# Altium schematic sheet Connector_Section.SchDoc
size A; DocumentNumber: 8; SheetNumber: 8; SheetTotal: 8
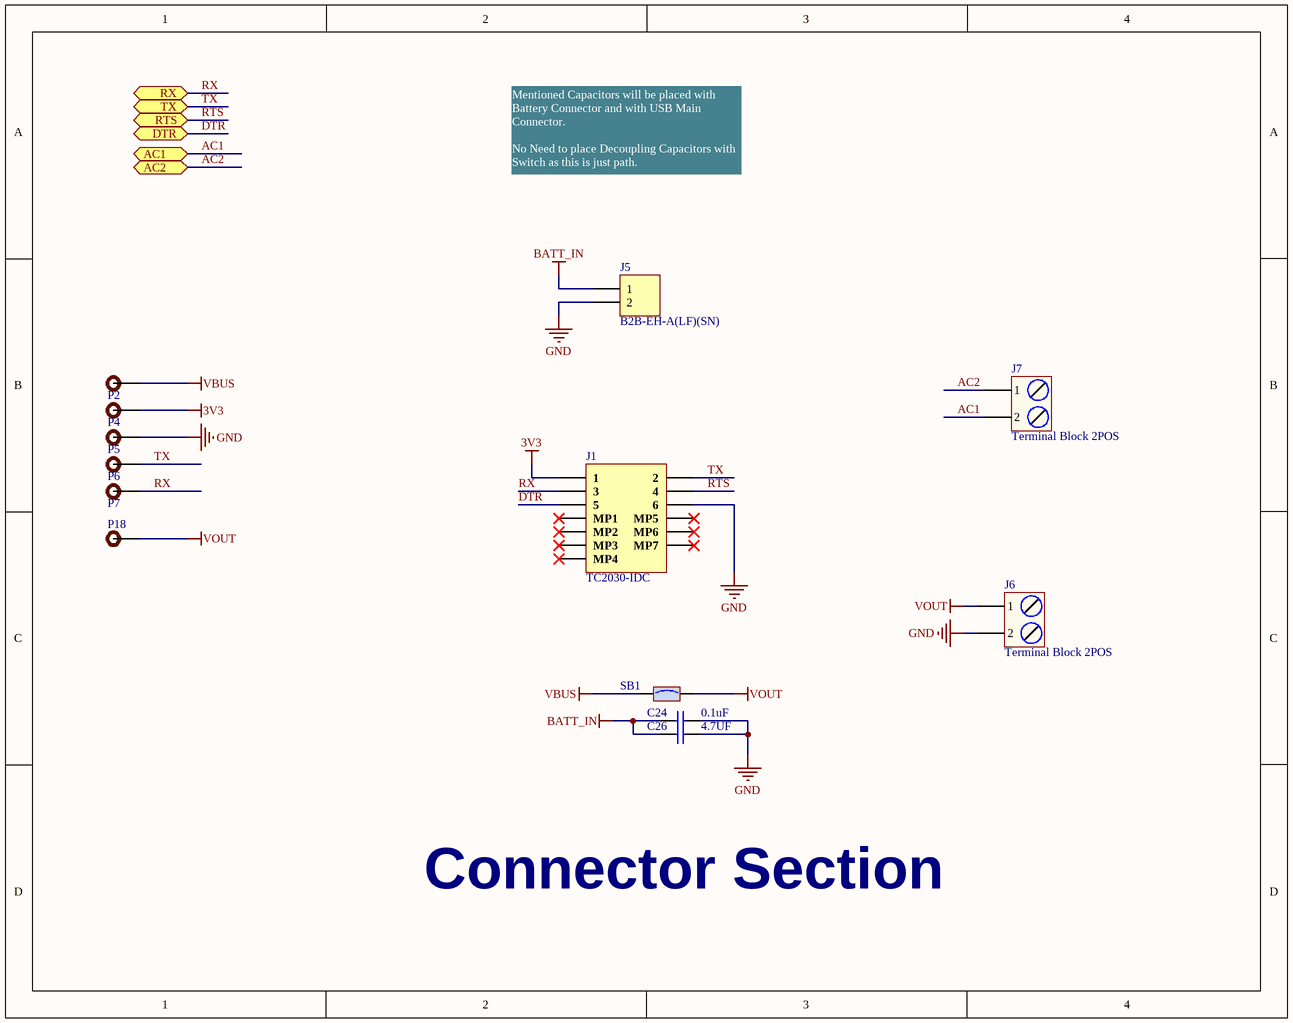
[diagram p0: Connector_Section.SchDoc]

## Parts
C24  0.1uF  [Cap0805]
C26  4.7UF  [Cap0805]
J1  TC2030-IDC  [TC2030-IDC]
J5  B2B-EH-A(LF)(SN)  [B2B-EH-A(LF)(SN)]
J6  Terminal Block 2POS  [Terminal Block 2P]
J7  Terminal Block 2POS  [Terminal Block 2P]
P2  TEST POINT  [TEST POINT]  (value not drawn)
P4  TEST POINT  [TEST POINT]  (value not drawn)
P5  TEST POINT  [TEST POINT]  (value not drawn)
P6  TEST POINT  [TEST POINT]  (value not drawn)
P7  TEST POINT  [TEST POINT]  (value not drawn)
P18  TEST POINT  [TEST POINT]  (value not drawn)
SB1  Solder Bridge  [Solder Bridge]  (value not drawn)

## Ports
AC1 (bidir), AC2 (bidir), DTR (bidir), RTS (bidir), RX (bidir), TX (bidir)

## Nets
3V3: J1.1 P4.1
BATT_IN: C24.1 C26.1 J5.1
GND: C24.2 C26.2 J1.6 J5.2 J6.2 P5.1
VBUS: P2.1 SB1.1
VOUT: J6.1 P18.1 SB1.2
AC1: J7.2 ; port AC1
AC2: J7.1 ; port AC2
DTR: J1.5 ; port DTR
RTS: J1.4 ; port RTS
RX: J1.3 P7.1 ; port RX
TX: J1.2 P6.1 ; port TX

Not connected (* = marked no-connect by the designer): J1 MP1* MP2* MP3* MP4* MP5* MP6* MP7*

## Notes on the sheet
- Mentioned Capacitors will be placed with Battery Connector and with USB Main Connector.
  No Need to place Decoupling Capacitors with Switch as this is just path.
- Connector Section

## Library data of the parts
C24 = CL21F104ZBCNNNC: CAP CER 0.1UF 50V Y5V 0805; Manufacturer: Samsung; Material: Ceramic; Capacitance: 100nF; Tolerance: 80%; Supplier 1: Digi-Key; Manufacturer Part Number: CL21F104ZBCNNNC; Stock 1: 4901061; Pricing 1: 1=0.1, 10=0.044, 100=0.0195, 500=0.0139, 1000=0.01092 (USD); Mount: Surface Mount; Case/Package: 0805; Case Code (Metric): 2012; Case Code (Imperial): 0805; Min Operating Temperature: -30°C; Max Operating Temperature: 85°C; Dielectric: Y5V; Packaging: Tape and Reel; Voltage Rating: 50V; Package Quantity: 1; Length: 2mm; Height: 0.85mm; Width: 0.049inch; Thickness: 0.037inch; Depth: 1.25mm; Radiation Hardening: No; ComponentLink1URL: https://media.digikey.com/pdf/Data%20Sheets/Samsung%20PDFs/CL_Series_MLCC_ds.pdf?src-supplier=Digi-Key; ComponentLink1Description: https://media.digikey.com/pdf/Data%20Sheets/Samsung%20PDFs/CL_Series_MLCC_ds.pdf?src-supplier=Digi-Key; Supplier Part Number 1: 1276-1007-6-ND
C26 = C0805C475K4PACTU: CAP CER 4.7UF 16V 10% X5R 0805; Manufacturer: KEMET; Dielectric Material: Ceramic; ComponentLink1URL: http://www.samsungsem.com/global/support/library/product-catalog/__icsFiles/afieldfile/2014/11/13/MLCC.pdf?src-supplier=Digi-Key; ComponentLink1Description: http://www.samsungsem.com/global/support/library/product-catalog/__icsFiles/afieldfile/2014/11/13/MLCC.pdf?src-supplier=Digi-Key; ComponentLink2URL: http://www1.futureelectronics.com/doc/SAMSUNG%20PASSIVE/CL05B104KQ5NNNC.pdf?src-supplier=Future+Electronics; ComponentLink2Description: http://www1.futureelectronics.com/doc/SAMSUNG%20PASSIVE/CL05B104KQ5NNNC.pdf?src-supplier=Future+Electronics; ComponentLink3URL: https://www.distrelec.biz/Web/Downloads/_e/ng/MLCC_CatalogDownload2013_ENG.pdf?mime=application%2Fpdf&src-supplier=Distrelec; ComponentLink3Description: https://www.distrelec.biz/Web/Downloads/_e/ng/MLCC_CatalogDownload2013_ENG.pdf?mime=application%2Fpdf&src-supplier=Distrelec; ComponentLink4URL: https://produktinfo.conrad.com/datenblaetter/450000-474999/455935-da-01-en-VS_KONDENSATOR_0805.pdf?src-supplier=Conrad; ComponentLink4Description: https://produktinfo.conrad.com/datenblaetter/450000-474999/455935-da-01-en-VS_KONDENSATOR_0805.pdf?src-supplier=Conrad; Supplier 1: Newark; Manufacturer Part Number: C0805C475K4PACTU; Stock 1: 22500; Pricing 1: 1=0.142, 2500=0.14, 5000=0.139, 10000=0.137 (USD); Mount: Surface Mount; Case/Package: 0805; Min Operating Temperature: -55°C; Max Operating Temperature: 85°C; Capacitance: 4.7uF; Tolerance: 10%; Packaging: Tape and Reel; Dielectric: X5R; Voltage: 16V; Termination: SMD/SMT; Voltage Rating (DC): 16V; Length: 2mm; Height: 1.25mm; Depth: 1.25mm; Radiation Hardening: No; Lead Free: Lead Free; ComponentLink5URL: http://capacitoredge.kemet.com/capedge2/DataSheet?pn=C0805C475K4PAC7800&src-supplier=Avnet+Europe; ComponentLink5Description: http://capacitoredge.kemet.com/capedge2/DataSheet?pn=C0805C475K4PAC7800&src-supplier=Avnet+Europe; ComponentLink6URL: https://www.verical.com/server-webapp/html/getDatasheet?partID=319476&src-supplier=Verical; ComponentLink6Description: https://www.verical.com/server-webapp/html/getDatasheet?partID=319476&src-supplier=Verical; Supplier Part Number 1: 36X2756
J1 = TC2030-IDC: CABLE ADAPTER 6 POS; Manufacturer: Tag-Connect; ComponentLink1URL: http://www.tag-connect.com/Materials/TC2030-MCP%20Datasheet.pdf?src-supplier=Digi-Key; ComponentLink1Description: http://www.tag-connect.com/Materials/TC2030-MCP%20Datasheet.pdf?src-supplier=Digi-Key; Supplier 1: Digi-Key; Manufacturer Part Number: TC2030-IDC; Stock 1: 284; Pricing 1: 1=43.71 (USD); Package Quantity: 1; Supplier Part Number 1: TC2030-IDC-ND
J5 = B2B-EH-A(LF)(SN): CONN HEADER VERT 2POS 2.5MM; Manufacturer: JST; Current Rating: 3A; Voltage Rating: 250V; Contact Resistance: 20mR; Number of Positions: 2; Connector Type: Male Pin,Plug; Gender: Male; Supplier 1: Digi-Key; Manufacturer Part Number: B2B-EH-A(LF)(SN); Stock 1: 25023; Pricing 1: 1=0.14, 10=0.131, 100=0.0809, 500=0.06698, 1000=0.05861, 5000=0.05024, 10000=0.04884 (USD); Mount: Through Hole; Contact Material: Copper Alloy,Brass; Color: Natural; Contact Plating: Tin,Copper; Housing Color: White; Housing Material: Nylon; Min Operating Temperature: -25°C; Max Operating Temperature: 85°C; Number of Rows: 1; Fastening Type: Detent; Packaging: Bulk; Max Current Rating: 3A; Termination: Press-Fit; Number of Contacts: 2; Max Voltage Rating (AC): 250V; Orientation: Straight; Length: 7.5mm; Pitch: 2.5mm; Contact Mating Length: 0.13inch; Depth: 3.8mm; Lead Free: Lead Free; ComponentLink1URL: http://uk.rs-online.com/webdocs/05aa/0900766b805aab1f.pdf?src-supplier=RSComponents; ComponentLink1Description: http://uk.rs-online.com/webdocs/05aa/0900766b805aab1f.pdf?src-supplier=RSComponents; ComponentLink2URL: http://www.jst-mfg.com/product/pdf/eng/eEH.pdf?src-supplier=Digi-Key; ComponentLink2Description: http://www.jst-mfg.com/product/pdf/eng/eEH.pdf?src-supplier=Digi-Key; ComponentLink3URL: https://www.verical.com/server-webapp/html/getDatasheet?partID=639961&src-supplier=Verical; ComponentLink3Description: https://www.verical.com/server-webapp/html/getDatasheet?partID=639961&src-supplier=Verical; ComponentLink4URL: http://www1.futureelectronics.com/doc/JST/B2B-EH-A(LF)(SN).pdf?src-supplier=Future+Electronics; ComponentLink4Description: http://www1.futureelectronics.com/doc/JST/B2B-EH-A(LF)(SN).pdf?src-supplier=Future+Electronics; ComponentLink5URL: http://www.produktinfo.conrad.com/datenblaetter/1200000-1299999/001217319-da-01-en-STIFTLEISTE_GERADE_2_POL__RM_25MM.pdf?src-supplier=Conrad; ComponentLink5Description: http://www.produktinfo.conrad.com/datenblaetter/1200000-1299999/001217319-da-01-en-STIFTLEISTE_GERADE_2_POL__RM_25MM.pdf?src-supplier=Conrad; Supplier Part Number 1: 455-1611-ND
J6 J7 = Terminal Block 2POS: TERMINAL BLOCK 2POS 5.08MM SIDE; Manufacturer: TE Connectivity; Manufacturer P/N: 1776493-2
P2 P4-P7 P18 = TEST POINT: Test Point ON
SB1 = Solder Bridge: Solder Bridge ON